# Altium schematic sheet USB32 GEN1 5G_REAR.schdoc
size 420 x 298 mm; Symbol: Sheet-Symbol_A3; Company: 嘉立创EDA; Version: V1.0; Page Size: A3; @Project Name: 【全网首发】X86电脑主板_copy; @Page Count: 20; @Update Date: 2025-10-09; @Create Date: 2025-10-09; @Schematic Name: SCHEMATIC1_1; @Page No: 0; @Page Name: USB32 GEN1 5G_REAR; Device: Sheet-Symbol_A3
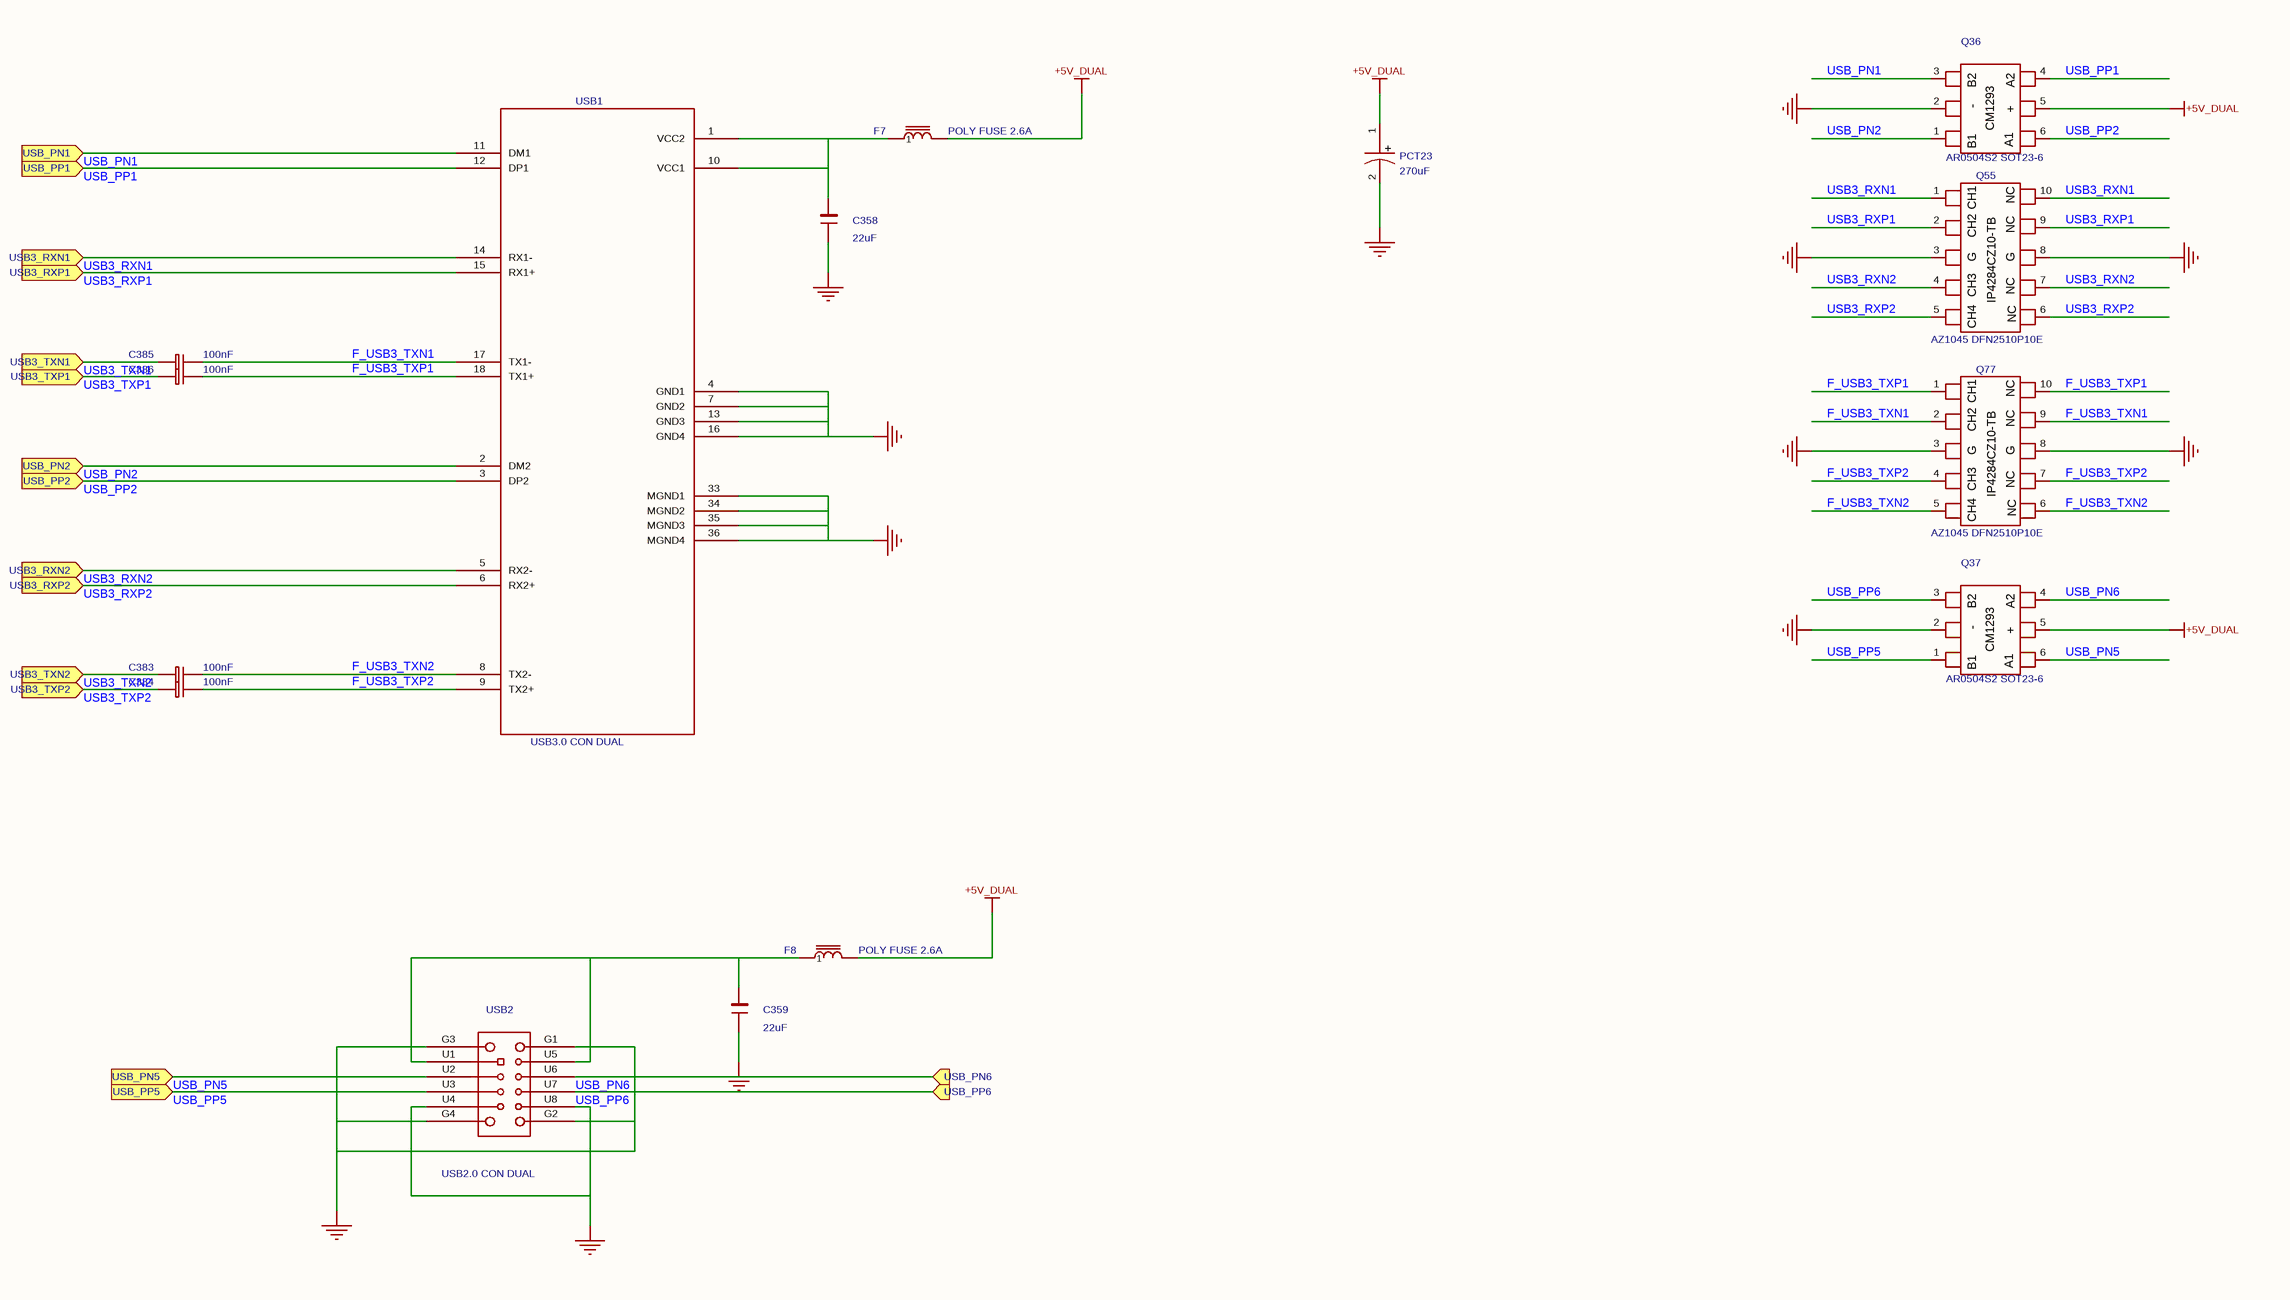
[diagram p0: USB32 GEN1 5G_REAR.schdoc]

## Parts
C358  22uF  [C0603]
C359  22uF  [C0603_1]
C383  100nF  [C0402]
C384  100nF  [C0402]
C385  100nF  [C0402]
C386  100nF  [C0402]
F7  value POLY FUSE 2.6A  [MINISMDC110]  (hidden comment: FERRITE BEAD)
F8  value POLY FUSE 2.6A  [MINISMDC110]  (hidden comment: FERRITE BEAD)
PCT23  270uF  [EC1P25C_2]
Q36  value AR0504S2 SOT23-6  [SOT23-6P-20051228_2]  (hidden comment: SRV05-4)
Q37  value AR0504S2 SOT23-6  [SOT23-6P-20051228_2]  (hidden comment: SRV05-4)
Q55  value AZ1045 DFN2510P10E  [DFN2510P10E]  (hidden comment: AZ1045-04F)
Q77  value AZ1045 DFN2510P10E  [DFN2510P10E_1]  (hidden comment: AZ1045-04F)
USB1  value USB3.0 CON DUAL  [USB3III]  (hidden comment: USB-303WSD-BRY)
USB2  value USB2.0 CON DUAL  [USB]  (hidden comment: USB-269-BRW)

## Ports
USB3_RXN1 (in), USB3_RXN2 (in), USB3_RXP1 (in), USB3_RXP2 (in), USB3_TXN1 (in), USB3_TXN2 (in), USB3_TXP1 (in), USB3_TXP2 (in), USB_PN1 (in), USB_PN2 (in), USB_PN5 (in), USB_PN6 (in), USB_PP1 (in), USB_PP2 (in), USB_PP5 (in), USB_PP6 (in)

## Nets
+5V_DUAL: F7.2 F8.2 PCT23.1 Q36.5(+) Q37.5(+)
GND: C358.2 C359.2 PCT23.2 Q36.2 Q37.2 Q55.3 Q55.8 Q77.3 Q77.8 USB1.4(GND1) USB1.7(GND2) USB1.13(GND3) USB1.16(GND4) USB1.33(MGND1) USB1.34(MGND2) USB1.35(MGND3) USB1.36(MGND4) USB2.G1(GNDG1) USB2.G2(GNDG2) USB2.G3(GNDG3) USB2.G4(GNDG4) USB2.U4 USB2.U8
F_USB3_TXN1: C385.1 Q77.2 Q77.9 USB1.17(TX1-)
F_USB3_TXN2: C383.1 Q77.5(+) Q77.6 USB1.8(TX2-)
F_USB3_TXP1: C386.1 Q77.1 Q77.10 USB1.18(TX1+)
F_USB3_TXP2: C384.1 Q77.4 Q77.7 USB1.9(TX2+)
USB3_RXN1: Q55.1 Q55.10 USB1.14(RX1-) ; port USB3_RXN1
USB3_RXN2: Q55.4 Q55.7 USB1.5(RX2-) ; port USB3_RXN2
USB3_RXP1: Q55.2 Q55.9 USB1.15(RX1+) ; port USB3_RXP1
USB3_RXP2: Q55.5(+) Q55.6 USB1.6(RX2+) ; port USB3_RXP2
USB3_TXN1: C385.2 ; port USB3_TXN1
USB3_TXN2: C383.2 ; port USB3_TXN2
USB3_TXP1: C386.2 ; port USB3_TXP1
USB3_TXP2: C384.2 ; port USB3_TXP2
USB_PN1: Q36.3 USB1.11(DM1) ; port USB_PN1
USB_PN2: Q36.1 USB1.2(DM2) ; port USB_PN2
USB_PN5: Q37.6 USB2.U2 ; port USB_PN5
USB_PN6: Q37.4 USB2.U6 ; port USB_PN6
USB_PP1: Q36.4 USB1.12(DP1) ; port USB_PP1
USB_PP2: Q36.6 USB1.3(DP2) ; port USB_PP2
USB_PP5: Q37.1 USB2.U3 ; port USB_PP5
USB_PP6: Q37.3 USB2.U7 ; port USB_PP6
NetC358_1: C358.1 F7.1 USB1.1(VCC2) USB1.10(VCC1)
NetC359_1: C359.1 F8.1 USB2.U1 USB2.U5

## Notes on the sheet
- 更新日期
- 2025-10-09
- 原理图
- 图页
- SCHEMATIC1_1
- USB32 GEN1 5G_REAR
- 创建日期
- 物料编码
- 审阅
- 绘制
- 【全网首发】X86电脑主板_copy
- 版本
- V1.0
- 尺寸
- A3
- 页
- 0
- 嘉立创EDA
- 共
- 20
- (in symbol 160AREC271M0609) +
- (in symbol AZ1045-04F) NC; CH1; CH2; G; CH3; IP4284CZ10-TB; CH4
- (in symbol SRV05-4_C558418) B2; A2; CM1293; -; B1; A1

## Library data of the parts
C358 C359 = CL10A226MQ8NRNC: 容值:22uF;精度:±20%;额定电压:6.3V;材质(温度系数):X5R;; Manufacturer: SAMSUNG(三星); Symbol: C0805; AddInBom: yes; Tolerance: ±20%; Voltage Rated: 6.3V; Temperature Coefficient: X5R; ModelId: ac125912035d415993ca9572d50418b1; ModelName: C0603_L1.6-W0.8-H0.8; ModelTransform: 62.992,31.496,0,0,0,0,0,0,0; Device: CL10A226MQ8NRNC; Value: 22uF; LCSC Part Name: 22uF ±20% 6.3V; SupplierPart: C59461; ManufacturerPart: CL10A226MQ8NRNC; Supplier Footprint: 0603; JLCPCB Part Class: Basic Part; Datasheet: https://atta.szlcsc.com/upload/public/pdf/source/20160218/1457707763339.pdf; Supplier: LCSC; ConvertToPcb: yes
  C358: FootprintName: C0603
  C359: FootprintName: C0603_1
C383-C386 = CC0402KRX7R7BB104: 容值:100nF;精度:±10%;额定电压:16V;材质(温度系数):X7R;; Manufacturer: YAGEO(国巨); Symbol: CAP NP_21; ModelId: 36a51122f27c49738f86b3bfa98863e0; Tolerance: ±10%; AddInBom: yes; Voltage Rated: 16V; ModelName: C0402_L1.0-W0.5-H0.5; ModelTransform: 39.37,19.685,0,0,0,0,0,0,0; Temperature Coefficient: X7R; Device: CC0402KRX7R7BB104; Value: 100nF; Supplier: LCSC; Datasheet: https://atta.szlcsc.com/upload/public/pdf/source/20211223/9278FD768280B81DDBEF48FA36411A03.pdf; FootprintName: C0402; SupplierPart: C60474; ConvertToPcb: yes; LCSC Part Name: 100nF ±10% 16V; JLCPCB Part Class: Extended Part; ManufacturerPart: CC0402KRX7R7BB104; Supplier Footprint: 0402
F7 F8 = FERRITE BEAD_3: Check: false; AddInBom: yes; Device: FERRITE BEAD_3; Symbol: FERRITE BEAD; FootprintName: MINISMDC110; ConvertToPcb: yes
PCT23 = 160AREC271M0609: 容值:270uF;精度:±20%;额定电压:16V;纹波电流:3.8A@100kHz;等效串联电阻:15mΩ@100kHz~300kHz;类型:-;; Manufacturer: APAQ(钰邦); Symbol: CAPACITOR POL_0; AddInBom: yes; ModelId: 0a4db4bf24b443b3be4905be97ff10c5; ModelName: CAP-TH_BD6.3-P2.50-D1.0-FD; ModelTransform: 248.4247,247.99777,0,0,0,0,0,0,-137.795; Tolerance: ±20%; Rated Voltage: 16V; φD: 6.3mm; L: 9mm; Lifetime @ Temp: 2000hrs@105℃; Device: 160AREC271M0609; Value: 270uF; LCSC Part Name: 270uF ±20% 16V; SupplierPart: C176312; ManufacturerPart: 160AREC271M0609; Supplier Footprint: 插件,D6.3xL9mm; JLCPCB Part Class: Extended Part; Datasheet: https://atta.szlcsc.com/upload/public/pdf/source/20180420/C176312_A6CC051F3F5535015096354530D22B11.pdf; Supplier: LCSC; ConvertToPcb: yes; FootprintName: EC1P25C_2; Ripple Current: 3.8A@100kHz; Equivalent Series Resistance(ESR): 15mΩ@100kHz~300kHz; Type: -; Lead Spacing: 2.5mm; Operating Temperature: -55℃~+105℃
Q36 Q37 = SRV05-4_C558418: 反向截止电压(Vrwm):5V;最大钳位电压:20V;峰值脉冲电流(Ipp)@10/1000us:3A;击穿电压:6V;; Manufacturer: TECH PUBLIC(台舟); Symbol: CM1293_0; AddInBom: yes; ModelId: 18da8f6c14a34920b3e136b5c401a119; ModelName: SOT-23-6_L2.9-W1.6-H1.5-LS2.8-P0.95; ModelTransform: 110.236,113.364,0,90,0,0,0.0005,0.0005,0; Reverse Stand-Off Voltage (Vrwm): 5V; Maximum Clamping Voltage: 20V; Peak Pulse Current (Ipp)@10/1000us: 3A; Breakdown Voltage: 6V; Type: ESD; Device: SRV05-4_C558418; LCSC Part Name: ESD，可防25kV静电; SupplierPart: C558418; ManufacturerPart: SRV05-4; Supplier Footprint: SOT-23-6; JLCPCB Part Class: Extended Part; Datasheet: https://atta.szlcsc.com/upload/public/pdf/source/20230615/CFFDFFE99FDA0E92DF9600783B3A2A20.pdf; Supplier: LCSC; ConvertToPcb: yes; FootprintName: SOT23-6P-20051228_2
Q55 Q77 = AZ1045-04F: Manufacturer: TECH PUBLIC(台舟); Symbol: CM1293_1; AddInBom: yes; ModelId: 55525fa8fc914f7c8ffcb10749ea5f73; ModelName: DFN-10_L2.5-W1.0-H0.5-P0.50; ModelTransform: 40.1574,98.425,0,90,0,0,0,0,0; Type: ESD; Device: AZ1045-04F; LCSC Part Name: AZ1045-04F; SupplierPart: C2987152; ManufacturerPart: AZ1045-04F; Supplier Footprint: DFN2510-10; JLCPCB Part Class: Extended Part; Datasheet: https://atta.szlcsc.com/upload/public/pdf/source/20220406/8EAFF16680D4CFE618D2B8CBCD10F1DA.pdf; Supplier: LCSC; ConvertToPcb: yes
  Q55: FootprintName: DFN2510P10E
  Q77: FootprintName: DFN2510P10E_1
USB1 = USB-303WSD-BRY: 连接器类型:Type-A;标准:USB 3.0;公母:母;端口数量:2;触点数量:9P+9P;安装方式:弯插;额定电流 - 电源:1.8A;工作温度范围:-30℃~+85℃;焊接温度(最大值):260℃;; Manufacturer: XUNPU(讯普); Symbol: REAR USB 3_0.0; AddInBom: yes; ModelId: 099f7116bbdc404e98854c37ac96170a; ModelName: USB-A-TH_XUNPU_USB-303WSD-BRY; ModelTransform: 614.147,688.975,0,0,0,0,0,-166.339,-118.11; Connector Type: Type-A; Gender: 母; Number of Ports: 2; Number of Contacts: 9P+9P; Current Rating - Power (Max): 1.8A; Soldering Temperature(Max): 260℃; Device: USB-303WSD-BRY; LCSC Part Name: Type-A 母 弯插; SupplierPart: C2895028; ManufacturerPart: USB-303WSD-BRY; Supplier Footprint: 插件; JLCPCB Part Class: Extended Part; Datasheet: https://atta.szlcsc.com/upload/public/pdf/source/20230426/A73C665BA3413059F595E5846F1512B5.pdf; Supplier: LCSC; ConvertToPcb: yes; FootprintName: USB3III; Standard: USB 3.0; Mounting Style: 弯插; Operating Temperature Range: -30℃~+85℃
USB2 = USB-269-BRW: 连接器类型:Type-A;标准:USB 2.0;公母:母座;触点数量:4+4;端口数量:2;安装方式:弯插;额定电流 - 电源:1.5A;触头材质:-;触头镀层:-;工作温度范围:-20℃~+70℃;焊接温度(最大值):260℃;; Manufacturer: XUNPU(讯普); Symbol: USB_PORT_0; Gender: 母座; ModelId: 6e8712a987fe4b7299da11213ca5dd28; AddInBom: yes; ModelName: USB-A-TH_USB-269-BRW; Connector Type: Type-A; Number of Ports: 2; ModelTransform: 614.14798,677.164,0,0,0,0,0,181.102,-157.48; Number of Contacts: 4+4; Welding Temperature (Max): 260℃; Current Rating - Power (Max): 1.5A; Device: USB-269-BRW; Standard: USB 2.0; Supplier: LCSC; FootprintName: USB; SupplierPart: C720548; ConvertToPcb: yes; LCSC Part Name: Type-A 母座 弯插; Mounting Style: 弯插; Contact Plating: -; Contact Material: -; JLCPCB Part Class: Extended Part; ManufacturerPart: USB-269-BRW; Supplier Footprint: 插件; Operating Temperature Range: -20℃~+70℃